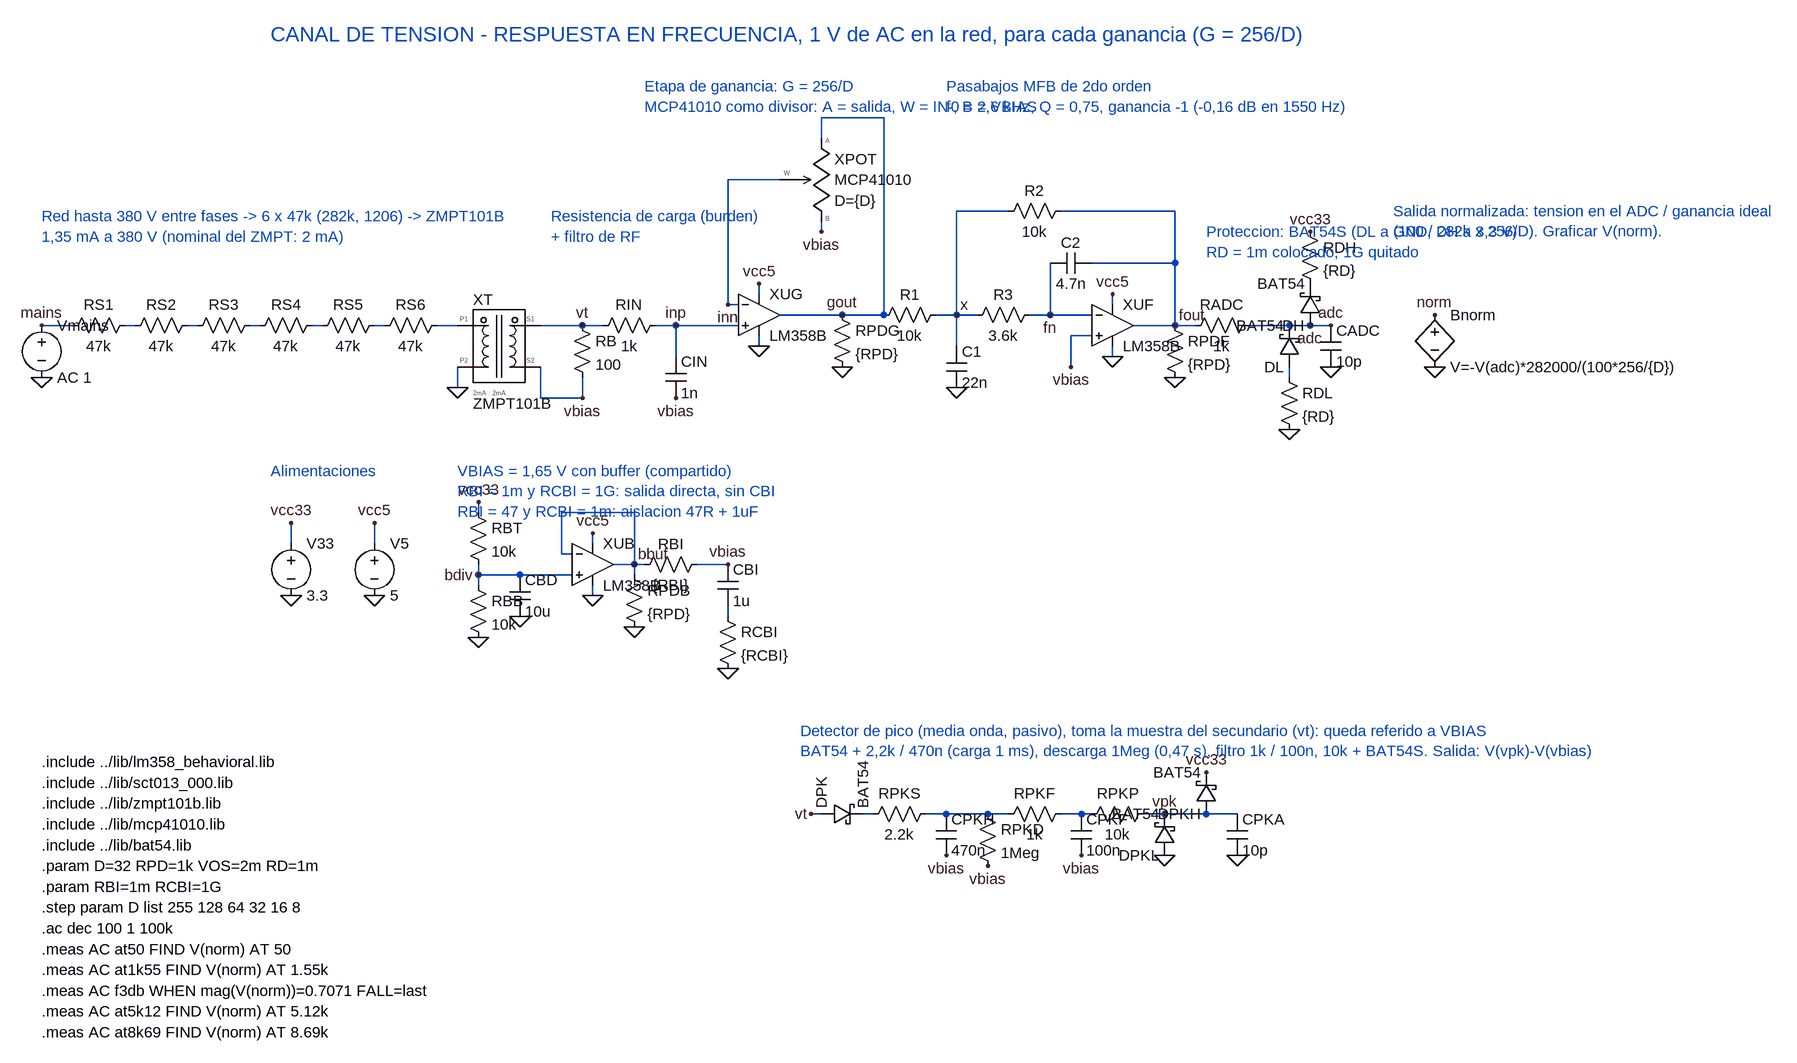
[diagram p0: schematic voltage_ac.asc]
voltage_ac.asc, the LTspice schematic file:
Version 4
SHEET 1 1880 1100
WIRE -1344 128 -1296 128
WIRE -1216 128 -1200 128
WIRE -1120 128 -1104 128
WIRE -1024 128 -1008 128
WIRE -928 128 -912 128
WIRE -832 128 -816 128
WIRE -736 128 -704 128
WIRE -704 192 -704 224
WIRE -576 128 -512 128
WIRE -576 192 -576 240
WIRE -576 240 -512 240
WIRE -512 240 -512 208
WIRE -512 128 -480 128
WIRE -400 128 -368 128
WIRE -368 128 -368 176
WIRE -368 128 -272 128
WIRE -240 80 -240 64
WIRE -240 144 -240 160
WIRE -208 -96 -288 -96
WIRE -288 -96 -288 96
WIRE -288 96 -272 96
WIRE -144 -32 -144 -16
WIRE -208 112 -112 112
WIRE -112 112 -48 112
WIRE -144 -160 -144 -192
WIRE -144 -192 -48 -192
WIRE -48 -192 -48 112
WIRE 32 112 64 112
WIRE 64 112 64 160
WIRE 64 112 96 112
WIRE 64 112 64 -48
WIRE 64 -48 144 -48
WIRE 176 112 208 112
WIRE 208 112 272 112
WIRE 208 112 208 32
WIRE 272 32 400 32
WIRE 224 -48 400 -48
WIRE 400 -48 400 32
WIRE 400 32 400 128
WIRE 336 128 400 128
WIRE 272 144 240 144
WIRE 240 144 240 192
WIRE 304 96 304 80
WIRE 304 160 304 176
WIRE 400 128 432 128
WIRE 512 128 576 128
WIRE 576 128 640 128
WIRE 576 192 576 208
WIRE -960 464 -960 432
WIRE -832 464 -832 432
WIRE -672 416 -672 400
WIRE -672 496 -672 512
WIRE -672 512 -672 528
WIRE -672 512 -608 512
WIRE -608 512 -528 512
WIRE -496 464 -496 448
WIRE -496 528 -496 544
WIRE -464 496 -432 496
WIRE -432 496 -432 416
WIRE -432 416 -544 416
WIRE -544 416 -544 480
WIRE -544 480 -528 480
WIRE -432 496 -432 512
WIRE -432 496 -416 496
WIRE -336 496 -288 496
WIRE -288 560 -288 576
WIRE -160 880 -144 880
WIRE -80 880 -64 880
WIRE 16 880 48 880
WIRE 48 880 112 880
WIRE 112 880 144 880
WIRE 224 880 256 880
WIRE 256 880 272 880
WIRE 352 880 448 880
WIRE 448 880 496 880
FLAG -1344 208 0
FLAG -1344 128 mains
FLAG -704 224 0
FLAG -512 240 vbias
FLAG -512 128 vt
FLAG -368 240 vbias
FLAG -368 128 inp
FLAG -240 64 vcc5
FLAG -240 160 0
FLAG -288 96 inn
FLAG -144 -16 vbias
FLAG -112 192 0
FLAG -112 112 gout
FLAG 64 224 0
FLAG 64 112 x
FLAG 208 112 fn
FLAG 240 192 vbias
FLAG 304 80 vcc5
FLAG 304 176 0
FLAG 400 208 0
FLAG 400 128 fout
FLAG 576 288 0
FLAG 640 192 0
FLAG 640 128 adc
FLAG -960 432 vcc33
FLAG -960 544 0
FLAG -832 432 vcc5
FLAG -832 544 0
FLAG -672 400 vcc33
FLAG -672 608 0
FLAG -608 576 0
FLAG -672 512 bdiv
FLAG -496 448 vcc5
FLAG -496 544 0
FLAG -432 592 0
FLAG -432 496 bbuf
FLAG -288 656 0
FLAG -288 496 vbias
FLAG 800 112 norm
FLAG 800 192 0
FLAG 608 128 adc
FLAG 608 -16 vcc33
FLAG -160 880 vt
FLAG 48 944 vbias
FLAG 112 960 vbias
FLAG 256 944 vbias
FLAG 384 880 vpk
FLAG 384 944 0
FLAG 448 816 vcc33
FLAG 496 944 0
SYMBOL voltage -1344 112 R0
SYMATTR InstName Vmains
SYMATTR Value AC 1
SYMBOL res -1200 112 R90
WINDOW 0 0 56 VBottom 2
WINDOW 3 32 56 VTop 2
SYMATTR InstName RS1
SYMATTR Value 47k
SYMBOL res -1104 112 R90
WINDOW 0 0 56 VBottom 2
WINDOW 3 32 56 VTop 2
SYMATTR InstName RS2
SYMATTR Value 47k
SYMBOL res -1008 112 R90
WINDOW 0 0 56 VBottom 2
WINDOW 3 32 56 VTop 2
SYMATTR InstName RS3
SYMATTR Value 47k
SYMBOL res -912 112 R90
WINDOW 0 0 56 VBottom 2
WINDOW 3 32 56 VTop 2
SYMATTR InstName RS4
SYMATTR Value 47k
SYMBOL res -816 112 R90
WINDOW 0 0 56 VBottom 2
WINDOW 3 32 56 VTop 2
SYMATTR InstName RS5
SYMATTR Value 47k
SYMBOL res -720 112 R90
WINDOW 0 0 56 VBottom 2
WINDOW 3 32 56 VTop 2
SYMATTR InstName RS6
SYMATTR Value 47k
SYMBOL ZMPT101B -640 128 R0
SYMATTR InstName XT
SYMATTR Value ZMPT101B
SYMBOL res -528 112 R0
SYMATTR InstName RB
SYMATTR Value 100
SYMBOL res -384 112 R90
WINDOW 0 0 56 VBottom 2
WINDOW 3 32 56 VTop 2
SYMATTR InstName RIN
SYMATTR Value 1k
SYMBOL cap -384 176 R0
SYMATTR InstName CIN
SYMATTR Value 1n
SYMBOL OpAmps\\opamp2 -240 48 R0
SYMATTR InstName XUG
SYMATTR Value LM358B
SYMATTR SpiceLine VOS={VOS}
SYMBOL res -128 96 R0
SYMATTR InstName RPDG
SYMATTR Value {RPD}
SYMBOL res 48 96 R90
WINDOW 0 0 56 VBottom 2
WINDOW 3 32 56 VTop 2
SYMATTR InstName R1
SYMATTR Value 10k
SYMBOL cap 48 160 R0
SYMATTR InstName C1
SYMATTR Value 22n
SYMBOL res 192 96 R90
WINDOW 0 0 56 VBottom 2
WINDOW 3 32 56 VTop 2
SYMATTR InstName R3
SYMATTR Value 3.6k
SYMBOL res 240 -64 R90
WINDOW 0 0 56 VBottom 2
WINDOW 3 32 56 VTop 2
SYMATTR InstName R2
SYMATTR Value 10k
SYMBOL OpAmps\\opamp2 304 64 R0
SYMATTR InstName XUF
SYMATTR Value LM358B
SYMBOL cap 272 16 R90
WINDOW 0 0 32 VBottom 2
WINDOW 3 32 32 VTop 2
SYMATTR InstName C2
SYMATTR Value 4.7n
SYMBOL res 384 112 R0
SYMATTR InstName RPDF
SYMATTR Value {RPD}
SYMBOL res 528 112 R90
WINDOW 0 0 56 VBottom 2
WINDOW 3 32 56 VTop 2
SYMATTR InstName RADC
SYMATTR Value 1k
SYMBOL schottky 592 192 R180
SYMATTR InstName DL
SYMATTR Value BAT54
SYMBOL res 560 192 R0
SYMATTR InstName RDL
SYMATTR Value {RD}
SYMBOL cap 624 128 R0
SYMATTR InstName CADC
SYMATTR Value 10p
SYMBOL voltage -960 448 R0
SYMATTR InstName V33
SYMATTR Value 3.3
SYMBOL voltage -832 448 R0
SYMATTR InstName V5
SYMATTR Value 5
SYMBOL res -688 400 R0
SYMATTR InstName RBT
SYMATTR Value 10k
SYMBOL res -688 512 R0
SYMATTR InstName RBB
SYMATTR Value 10k
SYMBOL cap -624 512 R0
SYMATTR InstName CBD
SYMATTR Value 10u
SYMBOL OpAmps\\opamp2 -496 432 R0
SYMATTR InstName XUB
SYMATTR Value LM358B
SYMBOL res -448 496 R0
SYMATTR InstName RPDB
SYMATTR Value {RPD}
SYMBOL res -320 480 R90
WINDOW 0 0 56 VBottom 2
WINDOW 3 32 56 VTop 2
SYMATTR InstName RBI
SYMATTR Value {RBI}
SYMBOL cap -304 496 R0
SYMATTR InstName CBI
SYMATTR Value 1u
SYMBOL res -304 560 R0
SYMATTR InstName RCBI
SYMATTR Value {RCBI}
SYMBOL bv 800 96 R0
SYMATTR InstName Bnorm
SYMATTR Value V=-V(adc)*282000/(100*256/{D})
SYMBOL schottky 624 128 R180
SYMATTR InstName DH
SYMATTR Value BAT54
SYMBOL res 592 -32 R0
SYMATTR InstName RDH
SYMATTR Value {RD}
SYMBOL schottky -144 896 R270
SYMATTR InstName DPK
SYMATTR Value BAT54
SYMBOL res 32 864 R90
WINDOW 0 0 56 VBottom 2
WINDOW 3 32 56 VTop 2
SYMATTR InstName RPKS
SYMATTR Value 2.2k
SYMBOL cap 32 880 R0
SYMATTR InstName CPKH
SYMATTR Value 470n
SYMBOL res 96 864 R0
SYMATTR InstName RPKD
SYMATTR Value 1Meg
SYMBOL res 240 864 R90
WINDOW 0 0 56 VBottom 2
WINDOW 3 32 56 VTop 2
SYMATTR InstName RPKF
SYMATTR Value 1k
SYMBOL cap 240 880 R0
SYMATTR InstName CPKF
SYMATTR Value 100n
SYMBOL res 368 864 R90
WINDOW 0 0 56 VBottom 2
WINDOW 3 32 56 VTop 2
SYMATTR InstName RPKP
SYMATTR Value 10k
SYMBOL schottky 400 944 R180
SYMATTR InstName DPKL
SYMATTR Value BAT54
SYMBOL schottky 464 880 R180
SYMATTR InstName DPKH
SYMATTR Value BAT54
SYMBOL cap 480 880 R0
SYMATTR InstName CPKA
SYMATTR Value 10p
SYMBOL MCP41010 -144 -160 R0
SYMATTR InstName XPOT
SYMATTR Value MCP41010
SYMATTR SpiceLine D={D}
TEXT -1344 -40 Left 2 ;Red hasta 380 V entre fases -> 6 x 47k (282k, 1206) -> ZMPT101B\n1,35 mA a 380 V (nominal del ZMPT: 2 mA)
TEXT -560 -40 Left 2 ;Resistencia de carga (burden)\n+ filtro de RF
TEXT -416 -240 Left 2 ;Etapa de ganancia: G = 256/D\nMCP41010 como divisor: A = salida, W = IN-, B = VBIAS
TEXT 48 -240 Left 2 ;Pasabajos MFB de 2do orden\nf0 = 2,6 kHz, Q = 0,75, ganancia -1 (-0,16 dB en 1550 Hz)
TEXT 448 -16 Left 2 ;Proteccion: BAT54S (DL a GND, DH a 3,3 V)\nRD = 1m colocado, 1G quitado
TEXT -992 352 Left 2 ;Alimentaciones
TEXT -704 352 Left 2 ;VBIAS = 1,65 V con buffer (compartido)\nRBI = 1m y RCBI = 1G: salida directa, sin CBI\nRBI = 47 y RCBI = 1m: aislacion 47R + 1uF
TEXT 736 -48 Left 2 ;Salida normalizada: tension en el ADC / ganancia ideal\n(100 / 282k x 256/D). Graficar V(norm).
TEXT -992 -320 Left 3 ;CANAL DE TENSION - RESPUESTA EN FRECUENCIA, 1 V de AC en la red, para cada ganancia (G = 256/D)
TEXT -1344 800 Left 2 !.include ../lib/lm358_behavioral.lib
TEXT -1344 832 Left 2 !.include ../lib/sct013_000.lib
TEXT -1344 864 Left 2 !.include ../lib/zmpt101b.lib
TEXT -1344 896 Left 2 !.include ../lib/mcp41010.lib
TEXT -1344 928 Left 2 !.include ../lib/bat54.lib
TEXT -1344 960 Left 2 !.param D=32 RPD=1k VOS=2m RD=1m
TEXT -1344 992 Left 2 !.param RBI=1m RCBI=1G
TEXT -1344 1024 Left 2 !.step param D list 255 128 64 32 16 8
TEXT -1344 1056 Left 2 !.ac dec 100 1 100k
TEXT -1344 1088 Left 2 !.meas AC at50 FIND V(norm) AT 50
TEXT -1344 1120 Left 2 !.meas AC at1k55 FIND V(norm) AT 1.55k
TEXT -1344 1152 Left 2 !.meas AC f3db WHEN mag(V(norm))=0.7071 FALL=last
TEXT -1344 1184 Left 2 !.meas AC at5k12 FIND V(norm) AT 5.12k
TEXT -1344 1216 Left 2 !.meas AC at8k69 FIND V(norm) AT 8.69k
TEXT -176 752 Left 2 ;Detector de pico (media onda, pasivo), toma la muestra del secundario (vt): queda referido a VBIAS\nBAT54 + 2,2k / 470n (carga 1 ms), descarga 1Meg (0,47 s), filtro 1k / 100n, 10k + BAT54S. Salida: V(vpk)-V(vbias)

The netlist it stands for:
* voltage_ac.asc
Vmains mains 0 AC 1
RS1 N001 mains 47k
RS2 N002 N001 47k
RS3 N003 N002 47k
RS4 N004 N003 47k
RS5 N005 N004 47k
RS6 N006 N005 47k
XXT N006 0 vt vbias ZMPT101B  ; pins P1 P2 S1 S2
RB vt vbias 100
RIN inp vt 1k
CIN inp vbias 1n
XXUG inp inn vcc5 0 gout LM358B VOS={VOS}  ; pins In+ In- V+ V- OUT
RPDG gout 0 {RPD}
R1 x gout 10k
C1 x 0 22n
R3 fn x 3.6k
R2 fout x 10k
XXUF vbias fn vcc5 0 fout LM358B  ; pins In+ In- V+ V- OUT
C2 fout fn 4.7n
RPDF fout 0 {RPD}
RADC adc fout 1k
DL N007 adc BAT54
RDL N007 0 {RD}
CADC adc 0 10p
V33 vcc33 0 3.3
V5 vcc5 0 5
RBT vcc33 bdiv 10k
RBB bdiv 0 10k
CBD bdiv 0 10u
XXUB bdiv bbuf vcc5 0 bbuf LM358B  ; pins In+ In- V+ V- OUT
RPDB bbuf 0 {RPD}
RBI vbias bbuf {RBI}
CBI vbias N008 1u
RCBI N008 0 {RCBI}
Bnorm norm 0 V=-V(adc)*282000/(100*256/{D})
DH adc P001 BAT54
RDH vcc33 P001 {RD}
DPK vt N009 BAT54
RPKS N010 N009 2.2k
CPKH N010 vbias 470n
RPKD N010 vbias 1Meg
RPKF N011 N010 1k
CPKF N011 vbias 100n
RPKP vpk N011 10k
DPKL 0 vpk BAT54
DPKH vpk vcc33 BAT54
CPKA vpk 0 10p
XXPOT gout inn vbias MCP41010 D={D}  ; pins A W B
.model D D
.lib standard.dio
* Red hasta 380 V entre fases -> 6 x 47k (282k, 1206) -> ZMPT101B
* 1,35 mA a 380 V (nominal del ZMPT: 2 mA)
* Resistencia de carga (burden)
* + filtro de RF
* Etapa de ganancia: G = 256/D
* MCP41010 como divisor: A = salida, W = IN-, B = VBIAS
* Pasabajos MFB de 2do orden
* f0 = 2,6 kHz, Q = 0,75, ganancia -1 (-0,16 dB en 1550 Hz)
* Proteccion: BAT54S (DL a GND, DH a 3,3 V)
* RD = 1m colocado, 1G quitado
* Alimentaciones
* VBIAS = 1,65 V con buffer (compartido)
* RBI = 1m y RCBI = 1G: salida directa, sin CBI
* RBI = 47 y RCBI = 1m: aislacion 47R + 1uF
* Salida normalizada: tension en el ADC / ganancia ideal
* (100 / 282k x 256/D). Graficar V(norm).
* CANAL DE TENSION - RESPUESTA EN FRECUENCIA, 1 V de AC en la red, para cada ganancia (G = 256/D)
.include ../lib/lm358_behavioral.lib
.include ../lib/sct013_000.lib
.include ../lib/zmpt101b.lib
.include ../lib/mcp41010.lib
.include ../lib/bat54.lib
.param D=32 RPD=1k VOS=2m RD=1m
.param RBI=1m RCBI=1G
.step param D list 255 128 64 32 16 8
.ac dec 100 1 100k
.meas AC at50 FIND V(norm) AT 50
.meas AC at1k55 FIND V(norm) AT 1.55k
.meas AC f3db WHEN mag(V(norm))=0.7071 FALL=last
.meas AC at5k12 FIND V(norm) AT 5.12k
.meas AC at8k69 FIND V(norm) AT 8.69k
* Detector de pico (media onda, pasivo), toma la muestra del secundario (vt): queda referido a VBIAS
* BAT54 + 2,2k / 470n (carga 1 ms), descarga 1Meg (0,47 s), filtro 1k / 100n, 10k + BAT54S. Salida: V(vpk)-V(vbias)
.backanno
.end